# Altium schematic sheet Power-Sheet.SchDoc
size A4; SheetNumber: 2; SheetTotal: 5
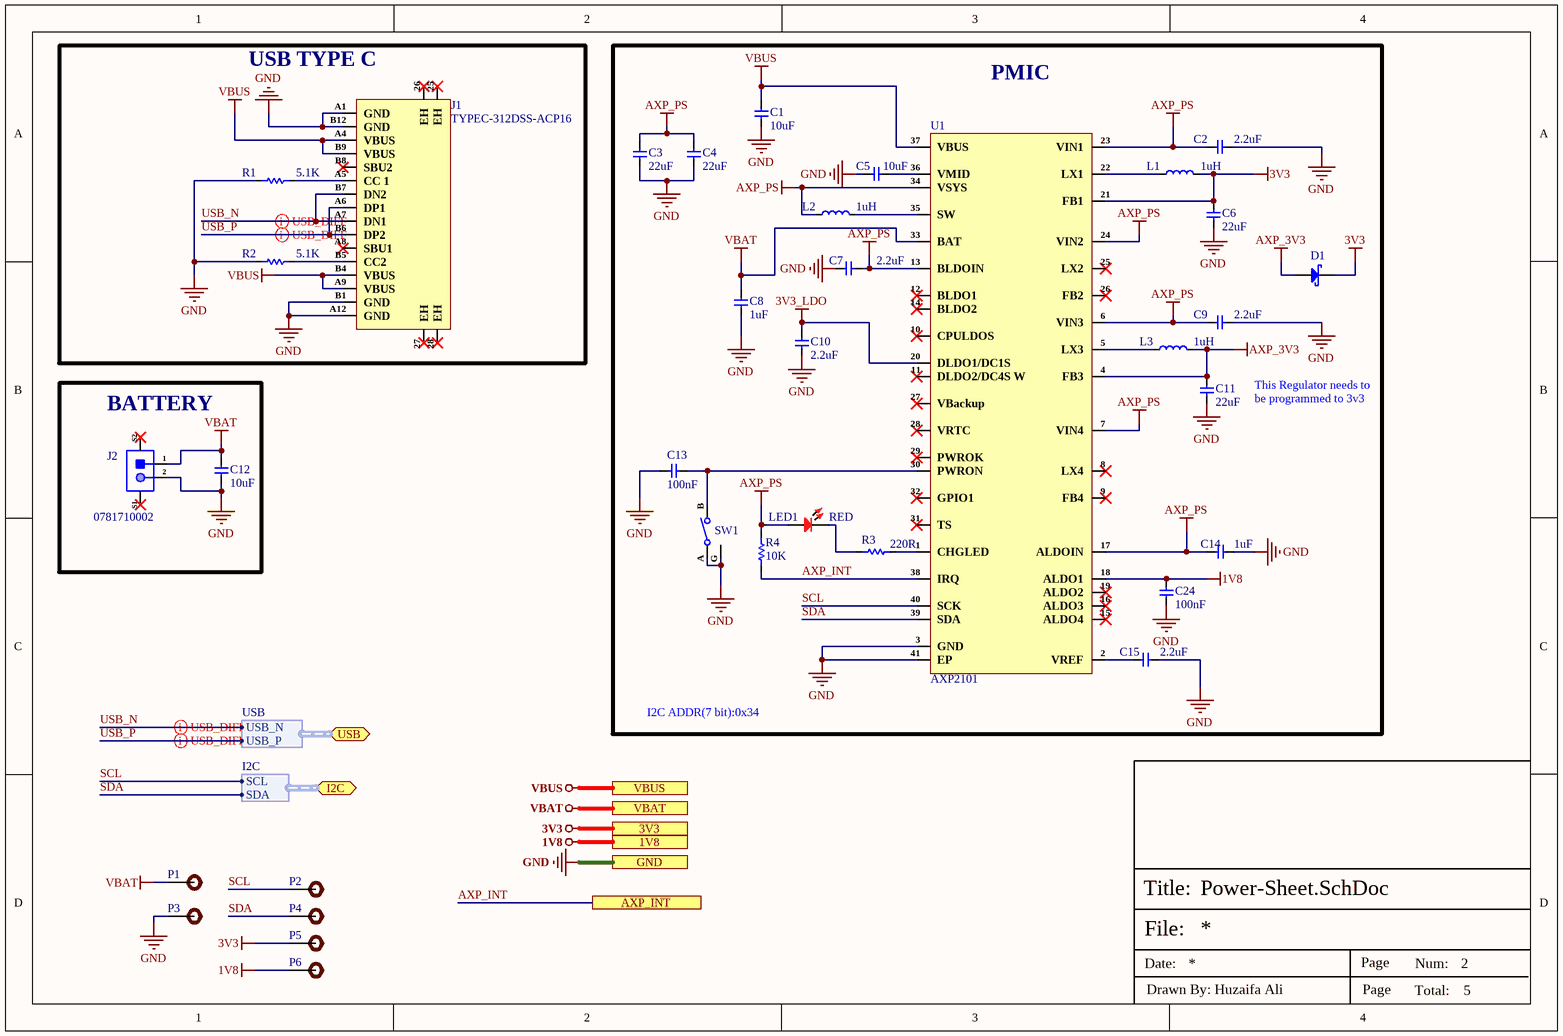
[diagram p0: Power-Sheet.SchDoc]

## Parts
C1  10uF  [Cap-0402]
C2  2.2uF  [CAP-0201]
C3  22uF  [Cap-0402]
C4  22uF  [Cap-0402]
C5  10uF  [Cap-0402]
C6  22uF  [Cap-0402]
C7  2.2uF  [CAP-0201]
C8  1uF  [CAP-0201]
C9  2.2uF  [CAP-0201]
C10  2.2uF  [CAP-0201]
C11  22uF  [Cap-0402]
C12  10uF  [Cap-0402]
C13  100nF  [CAP-0201]
C14  1uF  [CAP-0201]
C15  2.2uF  [CAP-0201]
C24  100nF  [CAP-0201]
D1  B5819WS  [SOD-323]  (value not drawn)
J1  TYPEC-312DSS-ACP16  [TYPEC-312DSS-ACP16]
J2  0781710002  [0781710002]
L1  1uH  [WPN201610M1R0MT]
L2  1uH  [WPN201610M1R0MT]
L3  1uH  [WPN201610M1R0MT]
LED1  RED  [LED-0201]
P1  TEST POINT 0.5mm Dia  [Test-point - 0.5mm]  (value not drawn)
P2  TEST POINT 0.5mm Dia  [Test-point - 0.5mm]  (value not drawn)
P3  TEST POINT 0.5mm Dia  [Test-point - 0.5mm]  (value not drawn)
P4  TEST POINT 0.5mm Dia  [Test-point - 0.5mm]  (value not drawn)
P5  TEST POINT 0.5mm Dia  [Test-point - 0.5mm]  (value not drawn)
P6  TEST POINT 0.5mm Dia  [Test-point - 0.5mm]  (value not drawn)
R1  5.1K  [Res-0201]
R2  5.1K  [Res-0201]
R3  220R  [Res-0201]
R4  10K  [Res-0201]
SW1  R-667799  [R-667799]  (value not drawn)
U1  AXP2101  [40-QFN (5mm×5mm)]

## Blocks framed on the sheet
USB TYPE C: J1 R1 R2
PMIC: C1-C11 C13-C15 C24 D1 L1-L3 LED1 R3 R4 SW1 U1
BATTERY: C12 J2

## Ports
1V8 (see Top-Sheet[1B], Sensor-Sheet[3C]), 3V3 (see Top-Sheet[1B], Controller-Sheet[3D], Display-Sheet[3D], Sensor-Sheet[3C]), AXP_INT (see Top-Sheet[2B], Controller-Sheet[3D]), GND (see Top-Sheet[1B], Controller-Sheet[3D], Display-Sheet[3D], Sensor-Sheet[3C]), I2C (bidir, harness I2C, see Top-Sheet[2B], Controller-Sheet[1D], Sensor-Sheet[3C]), USB (bidir, harness USB, see Top-Sheet[2B], Controller-Sheet[2D]), VBAT (see Top-Sheet[1B]), VBUS (see Top-Sheet[1B])

## Harnesses
USB: USB_N, USB_P
I2C: SCL, SDA

## Nets
1V8: C24.2 P6.1 U1.18(ALDO1) ; port 1V8
3V3: C6.2 D1.1(K) L1.2 P5.1 U1.21(FB1) ; port 3V3
3V3_LDO: C10.2 U1.20(DLDO1/DC1S)
AXP_3V3: C11.2 D1.2(A) L3.2 U1.4(FB3)
AXP_PS: C2.1 C3.2 C4.2 C7.2 C9.1 C14.2 L2.1 LED1.1 R4.2 U1.6(VIN3) U1.7(VIN4) U1.13(BLDOIN) U1.17(ALDOIN) U1.23(VIN1) U1.24(VIN2) U1.34(VSYS)
GND: C1.1 C2.2 C3.1 C4.1 C5.2 C6.1 C7.1 C8.1 C9.2 C10.1 C11.1 C12.2 C13.2 C14.1 C15.2 C24.1 J1.A1(GND) J1.A12(GND) J1.B1(GND) J1.B12(GND) J2.2 P3.1 R1.1 R2.1 SW1.A SW1.G U1.3(GND) U1.41(EP) ; port GND
VBAT: C8.2 C12.1 J2.1 P1.1 U1.33(BAT) ; port VBAT
VBUS: C1.2 J1.A4(VBUS) J1.A9(VBUS) J1.B4(VBUS) J1.B9(VBUS) U1.37(VBUS) ; port VBUS
AXP_INT: R4.1 U1.38(IRQ) ; port AXP_INT
SCL: P2.1 U1.40(SCK) ; port I2C.SCL
SDA: P4.1 U1.39(SDA) ; port I2C.SDA
USB_N: J1.A7(DN1) J1.B7(DN2) ; port USB.USB_N
USB_P: J1.A6(DP1) J1.B6(DP2) ; port USB.USB_P
NetC5_1: C5.1 U1.36(VMID)
NetC13_1: C13.1 SW1.B U1.30(PWRON)
NetC15_1: C15.1 U1.2(VREF)
NetJ1_A5: J1.A5(CC_1) R1.2
NetJ1_B5: J1.B5(CC2) R2.2
NetL1_1: L1.1 U1.22(LX1)
NetL2_2: L2.2 U1.35(SW)
NetL3_1: L3.1 U1.5(LX3)
NetLED1_2: LED1.2 R3.1
NetR3_2: R3.2 U1.1(CHGLED)

Not connected (* = marked no-connect by the designer): J1 25(EH)* 26(EH)* 27(EH)* 28(EH)* A8(SBU1)* B8(SBU2)*; J2 S1* S2*; U1 8(LX4)* 9(FB4)* 10(CPULDOS)* 11(DLDO2/DC4S_W)* 12(BLDO1)* 14(BLDO2)* 15(ALDO4)* 16(ALDO3)* 19(ALDO2)* 25(LX2)* 26(FB2)* 27(VBackup)* 28(VRTC)* 29(PWROK)* 31(TS)* 32(GPIO1)*

## Layout directives
differential pair; net class USB_DIFF; differential pair class USB_DIFF_Lines; rule Matched Net Lengths [Tolerance = 20mil]; rule Impedance Constraint [Min = 85.00    Max = 95.00    ]: USB_N, USB_P

## Notes on the sheet
- This Regulator needs to be programmed to 3v3
- I2C ADDR(7 bit):0x34
- File:
- Title:
- Date:
- Page
- Num:
- Total:
- Drawn By: Huzaifa Ali

## Library data of the parts
C1 C5 C12 = CC0402MRX5R6BB106: CAP CER 10UF 10V X5R 0402; Manufacturer: Yageo; Tolerance: 20%; Item Type: Capacitor; Supplier 1: Future Electronics; Manufacturer Part Number: CC0402MRX5R6BB106; RoHS: Yes; Category: Ceramic Capacitors; Stock 1: 80000; Pricing 1: 10000=0.02650, 20000=0.02590, 30000=0.02550, 40000=0.02530, 50000=0.02450 (USD); Mount: Surface Mount; Case/Package: 0402; Case Code (Imperial): 0402; Case Code (Metric): 1005; Min Operating Temperature: -55°C; Max Operating Temperature: 85°C; Packaging: Tape and Reel; Capacitance: 10uF; Voltage Rating: 10V; RoHS Compliant: Yes; ComponentLink1URL: http://www.yageo.com/documents/recent/UPY-GPHC_X5R_4V-to-50V_25.pdf?src-supplier=Digi-Key; ComponentLink1Description: http://www.yageo.com/documents/recent/UPY-GPHC_X5R_4V-to-50V_25.pdf?src-supplier=Digi-Key; Supplier Part Number 1: 6097631; LCSC Part Number: C962143
C2 C7 C9 C10 C15 = CC0201MRX5R6BB225: CAP CER 2.2UF 10V X5R 0201; Manufacturer: Yageo; Tolerance: 20%; Item Type: Capacitor; Supplier: Mouser; Supplier Part Number: 603-CC0201MRX56BB225; Manufacturer Part Number: CC0201MRX5R6BB225; RoHS: Yes; Category: Ceramic Capacitors; Stock: 25553; Pricing: 1=0.43, 10=0.294, 50=0.294, 100=0.176, 1000=0.112, 10000=0.091 (USD); Mounting Technology: Surface Mount; Case/Package: 0201; Min Operating Temperature: -55°C; Max Operating Temperature: 85°C; Packaging: Tape and Reel; Value: 2.2uF; Voltage Rating: 10V; Series: CC; RoHS Compliant: Yes; ComponentLink1URL: https://www.yageo.com/upload/media/product/productsearch/datasheet/mlcc/UPY-GPHC_X5R_4V-to-50V_26.pdf?src-supplier=Digi-Key; ComponentLink1Description: https://www.yageo.com/upload/media/product/productsearch/datasheet/mlcc/UPY-GPHC_X5R_4V-to-50V_26.pdf?src-supplier=Digi-Key; LCSC Part Number: C2186869
C3 C4 C6 C11 = GRM158R61A226ME15D: CAP CER 22UF 10V X5R 0402; Item Type: Capacitor; Material: 4241ConductorMaterial; Dielectric: 1537DielectricType; Tolerance: 20%; Supplier: Digi-Key; Supplier Part Number: 490-GRM158R61A226ME15DCT-ND; RoHS: Yes; Category: Ceramic Capacitors; Stock: 26634; Pricing: 1=0.45, 10=0.299, 50=0.2202, 100=0.1794, 500=0.1416, 1000=0.11957, 2500=0.11328 (USD); Case/Package: 343Case; Min Operating Temperature: -55°C; Max Operating Temperature: 85°C; Value: 22uF; Voltage Rating: 10V; Voltage Rating (DC): 10V; Length: 1mm; Width: 500um; Height: 800um; Thickness: 800um
C8 C14 = CC0201MRX5R7BB105: CAP CER 1UF 16V X5R 0201; Manufacturer: Yageo; Item Type: Capacitor; Supplier: Digi-Key; Supplier Part Number: 13-CC0201MRX5R7BB105TR-ND; Manufacturer Part Number: CC0201MRX5R7BB105; RoHS: Yes; Category: Ceramic Capacitors; LCSC Part Number: C5182464
C13 C24 = CC0201KRX5R6BB104: CAP CER 0.1UF 10V X5R 0201; Manufacturer: Yageo; Tolerance: 10%; Supplier 1: Mouser; Manufacturer Part Number: CC0201KRX5R6BB104; RoHS: Yes; Category: Ceramic Capacitors; Stock 1: 824403; Pricing 1: 1=0.10000, 10=0.02400, 50=0.02400, 100=0.01900, 1000=0.01100, 10000=0.00900 (USD); Mount: Surface Mount; Case/Package: 0201; Case Code (Imperial): 0201; Case Code (Metric): 0603; Weight: 6E-06oz; Min Operating Temperature: -55°C; Max Operating Temperature: 85°C; Capacitance: 100nF; Dielectric: X5R; Voltage Rating (DC): 10V; Packaging: Tape and Reel; Termination: SMD/SMT; Resistor Type: Ceramic; Voltage Rating: 10V; Series: CC; Construction: Flat; Length: 0.6mm; Width: 0.012inch; Height: 0.3mm; Thickness: 0.013inch; Depth: 0.3mm; Radiation Hardening: No; Lead Free: Lead Free; Halogen Free: Halogen Free; RoHS Compliant: Yes; ComponentLink1URL: https://datasheet.ciiva.com/11587/upy-gphc-x5r-4v-to-50v-12-11587190.pdf?src-supplier=Avnet; ComponentLink1Description: https://datasheet.ciiva.com/11587/upy-gphc-x5r-4v-to-50v-12-11587190.pdf?src-supplier=Avnet; Supplier Part Number 1: 603-CC201KRX5R6BB104; LCSC Part Number: C190183
D1 = B5819WS: DIODE SCHOTTKY 40V 1A SOD323; Manufacturer: MDD; Manufacturer Part Number: B5819WS-TP; Max Surge Current: 10A; Forward Voltage: 900mV; Max Reverse Leakage Current: 1mA; Element Configuration: Single; Supplier 1: Arrow Electronics; RoHS: Yes; Category: Rectifier Diodes; Stock 1: 1701; Pricing 1: 1=0.34370, 10=0.18990, 25=0.18810, 100=0.11820, 250=0.11700, 500=0.08890, 1000=0.07420 (USD); Mount: Surface Mount; Number of Pins: 2; Min Operating Temperature: -65°C; Max Operating Temperature: 125°C; Package Quantity: 1; Packaging: Tape and Reel; Average Rectified Current: 1A; Peak Non-Repetitive Surge Current: 10A; Max Reverse Voltage (DC): 40V; Series: -; Radiation Hardening: No; RoHS Compliant: Yes; Lead Free: Lead Free; Supplier Part Number 1: B5819WS-TP; ComponentLink1Description: LCSC; ComponentLink1URL: https://lcsc.com/product-detail/Schottky-Barrier-Diodes-SBD_MDD-Microdiode-Electronics-B5819WS_C64886.html; LCSC Part Number: C22624; Item Type: Diode
J1 = TYPEC-312DSS-ACP16: USB 3.1 5A 1 260℃ Surface Mount 16P Female -45℃~+85℃ Type-C SMD USB Connectors ROHS; Manufacturer: XUNPU; Manufacturer Part Number: TYPEC-312DSS-ACP16; Package: Custom; LCSC Part Number: C2909601; Item Type: Type-C SMD USB; ComponentLink1Description: LCSC; ComponentLink1URL: https://www.lcsc.com/product-detail/USB-Connectors_XUNPU-TYPEC-312DSS-ACP16_C2909601.html
J2 = 0781710002: CONN HEADER SMD 2POS 1.2MM; Manufacturer: Molex; Item Type: To Board / Wire To Wire Connector; Contact Resistance: 20mR; Max Voltage Rating (AC): 50V; Number of Contacts: 2; Manufacturer Part Number: 0781710002; Package: Custom; LCSC Part Number: C505023; ComponentLink1Description: LCSC; ComponentLink1URL: https://www.lcsc.com/product-detail/Wire-To-Board-Wire-To-Wire-Connector_MOLEX-781710002_C505023.html; Supplier: Mouser; Supplier Part Number: 538-78171-0002; RoHS: Yes; Stock: 82070; Pricing: 1=0.39, 10=0.313, 50=0.313, 100=0.228, 1000=0.181, 10000=0.141 (USD); Housing Material: Polymer; Contact Plating: Gold; Contact Material: Copper Alloy; Housing Color: Black; Min Operating Temperature: -25°C; Max Operating Temperature: 85°C; Number of Rows: 1; Packaging: Tape and Reel; Orientation: Straight; Termination: Solder; Length: 4.2mm; Pitch: 1.2mm; Depth: 4.5mm; Radiation Hardening: No; RoHS Compliant: Yes
L1-L3 = WPN201610M1R0MT: 2.05A 1uH ±20% 3.35A 0806 Power Inductors ROHS; Manufacturer: Sunlord; Supplier: Digi-Key; Supplier Part Number: 3442-WPN201610M1R0MTTR-ND; Manufacturer Part Number: WPN201610M1R0MT; RoHS: Yes; Pricing: 2000=0.17776 (USD); RoHS Compliant: Yes; LCSC Part Number: C97010; Item Type: Inductor
LED1 = XL-0201SURC: 40mcd~75mcd 透明透镜 620nm~630nm -30℃~+85℃ Positive post Red 120° 55mW 0201 Light Emitting Diodes (LED) ROHS; Manufacturer: XINGLIGHT; Manufacturer Part Number: XL-0201SURC; Package: 0201; LCSC Part Number: C3646923; Item Type: LED; ComponentLink1Description: LCSC; ComponentLink1URL: https://www.lcsc.com/product-detail/Light-Emitting-Diodes-LED_XINGLIGHT-XL-0201SURC_C3646923.html
P1-P6 = TEST POINT 0.5mm Dia: Test Point ON; Item Type: Test Point
R1 R2 = RC0201FR-075K1L: RES 5.1K OHM 1% 1/20W 0201; Manufacturer: Yageo; Power Rating: 50mW; Value: 5.1kR; Voltage Rating: 25V; Temperature Coefficient: 200ppm/°C; Item Type: Resistor; Supplier: Future Electronics; Supplier Part Number: 9072847; Manufacturer Part Number: RC0201FR-075K1L; RoHS: Yes; Category: Chip SMD Resistors; Stock: 280000; Pricing: 10000=0.0014, 40000=0.0013, 200000=0.0013, 400000=0.0012, 1250000=0.0011 (USD); Case/Package: 0201; Case Code (Imperial): 0201; Case Code (Metric): 0603; Min Operating Temperature: -55°C; Max Operating Temperature: 125°C; Packaging: Tape and Reel; Tolerance: 1%; Termination: SMD/SMT; Number of Terminations: 2; Max Power Dissipation: 50mW; Features: Moisture Resistant; Series: RC; Length: 0.6mm; Width: 0.3mm; Height: 0.23mm; Lead Free: Lead Free; RoHS Compliant: Yes; ComponentLink1URL: http://www.mouser.com/ds/2/447/RC0201-559633.pdf?src-supplier=Mouser; ComponentLink1Description: http://www.mouser.com/ds/2/447/RC0201-559633.pdf?src-supplier=Mouser; ComponentLink2URL: https://datasheet.octopart.com/RC0201FR-075K1L-Yageo-datasheet-164759695.pdf?src-supplier=Future+Electronics; ComponentLink2Description: https://datasheet.octopart.com/RC0201FR-075K1L-Yageo-datasheet-164759695.pdf?src-supplier=Future+Electronics; ComponentLink3URL: http://www.yageo.com/documents/recent/PYu-RC_Group_51_RoHS_L_10.pdf?src-supplier=Digi-Key; ComponentLink3Description: http://www.yageo.com/documents/recent/PYu-RC_Group_51_RoHS_L_10.pdf?src-supplier=Digi-Key; LCSC Part Number: C274341
R3 = RC0201FR-07220RL: RES 220 OHM 1% 1/20W 0201; Manufacturer: Yageo; Temperature Coefficient: 200ppm/°C; Power Rating: 50mW; Voltage Rating: 25V; Supplier 1: Digi-Key; Manufacturer Part Number: RC0201FR-07220RL; RoHS: Yes; Category: Chip SMD Resistors; Stock 1: 189347; Pricing 1: 1=0.10000, 10=0.03600, 100=0.01480, 1000=0.00665, 2500=0.00577, 5000=0.00477 (USD); Case/Package: 0201; Contact Plating: Tin,Matte; Case Code (Imperial): 0201; Case Code (Metric): 0603; Min Operating Temperature: -55°C; Max Operating Temperature: 125°C; Resistance: 220R; Tolerance: 1%; Resistor Type: Thick Film; Packaging: Tape and Reel; Features: Moisture Resistant; Max Power Dissipation: 50mW; Number of Terminations: 2; Termination: SMD/SMT; Length: 0.6mm; Width: 0.012inch; Height: 0.01inch; Depth: 0.3mm; Radiation Hardening: No; REACH SVHC: Unknown; Military Standard: Not; ComponentLink1URL: https://datasheet.ciiva.com/7672/1563626-7672213.pdf?src-supplier=Element14; ComponentLink1Description: https://datasheet.ciiva.com/7672/1563626-7672213.pdf?src-supplier=Element14; ComponentLink2URL: https://datasheet.ciiva.com/8886/pyu-rc0201-51-rohs-l-8-8886758.pdf?src-supplier=Avnet; ComponentLink2Description: https://datasheet.ciiva.com/8886/pyu-rc0201-51-rohs-l-8-8886758.pdf?src-supplier=Avnet; ComponentLink3URL: https://datasheet.ciiva.com/16855/pyu-rc0201-51-rohs-l-8-16855847.pdf?src-supplier=Avnet+Europe; ComponentLink3Description: https://datasheet.ciiva.com/16855/pyu-rc0201-51-rohs-l-8-16855847.pdf?src-supplier=Avnet+Europe; ComponentLink4URL: https://datasheet.ciiva.com/28393/pyu-rc0201-51-rohs-l-8-28393063.pdf?src-supplier=Avnet+Europe; ComponentLink4Description: https://datasheet.ciiva.com/28393/pyu-rc0201-51-rohs-l-8-28393063.pdf?src-supplier=Avnet+Europe; Supplier Part Number 1: YAG2509CT-ND; LCSC Part Number: C274342
R4 = RC0201FR-0710KL: RES SMD 10K OHM 1% 1/20W 0201; Manufacturer: Yageo; Item Type: Resistor; Manufacturer Part Number: RC0201FR-0710KL; Package: 0201; ComponentLink7Description: LCSC; ComponentLink7URL: https://www.lcsc.com/product-detail/Chip-Resistor-Surface-Mount_YAGEO-RC0201FR-0710KL_C106225.html; LCSC Part Number: C106225
SW1 = R-667799: SWITCH TACTILE, SPST-NO, 0.05A 1; Manufacturer: Mitsumi; Item Type: Tactile Switch; Supplier: Digi-Key; Supplier Part Number: 2508-R-667799CT-ND; Manufacturer Part Number: R-667799; RoHS: No; Category: Tactile Switches; Stock: 11526; Pricing: 1=0.32, 10=0.31, 25=0.2944, 100=0.2666, 250=0.24304, 500=0.2259, 1000=0.19271, 2500=0.18736 (USD)
U1 = AXP2101: QFN-40-EP(5x5) Microcontroller Units (MCUs/MPUs/SOCs) ROHS; Manufacturer: X-Powers Tech; Item Type: IC; Manufacturer Part Number: AXP2101; Package: QFN-40-EP(5x5); JLCPCB Part Number: C3036461